# Altium schematic sheet Parallel_NOR_FLASH.SchDoc
size A3; SheetNumber: 8; SheetTotal: 15
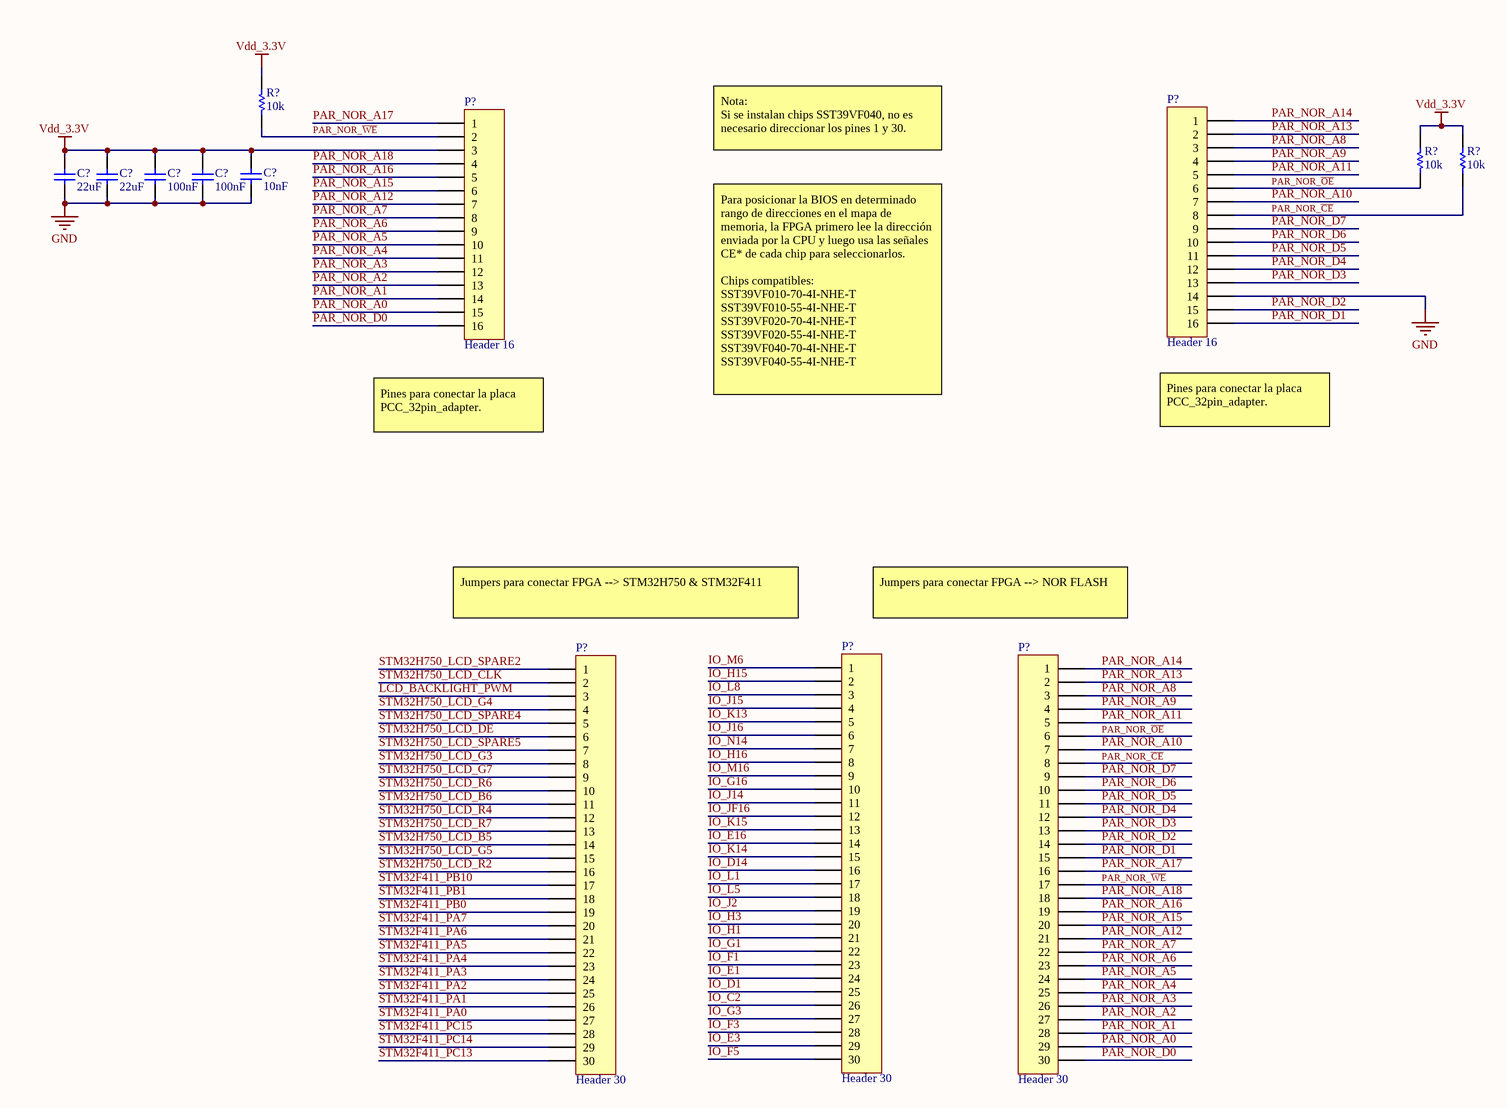
[diagram p0: Parallel_NOR_FLASH.SchDoc]

## Parts
(Parts that share a designator on the sheet are numbered #1, #2 ... from top to bottom, then left to right.)
C?#1  value 22uF  [capacitor 0603]  (hidden comment: ceramic capacitor)
C?#2  value 22uF  [capacitor 0603]  (hidden comment: ceramic capacitor)
C?#3  value 100nF  [capacitor 0603]  (hidden comment: Ceramic capacitor)
C?#4  value 100nF  [capacitor 0603]  (hidden comment: Ceramic capacitor)
C?#5  value 10nF  [capacitor 0603]  (hidden comment: Ceramic capacitor)
P?#1  Header 16  [HDR1X16]
P?#2  Header 16  [HDR1X16]
P?#3  Header 30  [HDR1X30]
P?#4  Header 30  [HDR1X30]
P?#5  Header 30  [HDR1X30]
R?#1  value 10k  [resistor 0603]  (hidden comment: resistor)
R?#2  value 10k  [resistor 0603]  (hidden comment: resistor)
R?#3  value 10k  [resistor 0603]  (hidden comment: resistor)

## Nets
GND: C?#1.1 C?#2.1 C?#3.1 C?#4.1 C?#5.1 P?#2.14
Vdd_3.3V: C?#1.2 C?#2.2 C?#3.2 C?#4.2 C?#5.2 P?#1.3 R?#1.1 R?#2.1 R?#3.1
IO_C2: P?#4.26
IO_D1: P?#4.25
IO_D14: P?#4.16
IO_E1: P?#4.24
IO_E3: P?#4.29
IO_E16: P?#4.14
IO_F1: P?#4.23
IO_F3: P?#4.28
IO_F5: P?#4.30
IO_G1: P?#4.22
IO_G3: P?#4.27
IO_G16: P?#4.10
IO_H1: P?#4.21
IO_H3: P?#4.20
IO_H15: P?#4.2
IO_H16: P?#4.8
IO_J2: P?#4.19
IO_J14: P?#4.11
IO_J15: P?#4.4
IO_J16: P?#4.6
IO_JF16: P?#4.12
IO_K13: P?#4.5
IO_K14: P?#4.15
IO_K15: P?#4.13
IO_L1: P?#4.17
IO_L5: P?#4.18
IO_L8: P?#4.3
IO_M6: P?#4.1
IO_M16: P?#4.9
IO_N14: P?#4.7
LCD_BACKLIGHT_PWM: P?#3.3
PAR_NOR_A0: P?#1.15 P?#5.29
PAR_NOR_A1: P?#1.14 P?#5.28
PAR_NOR_A2: P?#1.13 P?#5.27
PAR_NOR_A3: P?#1.12 P?#5.26
PAR_NOR_A4: P?#1.11 P?#5.25
PAR_NOR_A5: P?#1.10 P?#5.24
PAR_NOR_A6: P?#1.9 P?#5.23
PAR_NOR_A7: P?#1.8 P?#5.22
PAR_NOR_A8: P?#2.3 P?#5.3
PAR_NOR_A9: P?#2.4 P?#5.4
PAR_NOR_A10: P?#2.7 P?#5.7
PAR_NOR_A11: P?#2.5 P?#5.5
PAR_NOR_A12: P?#1.7 P?#5.21
PAR_NOR_A13: P?#2.2 P?#5.2
PAR_NOR_A14: P?#2.1 P?#5.1
PAR_NOR_A15: P?#1.6 P?#5.20
PAR_NOR_A16: P?#1.5 P?#5.19
PAR_NOR_A17: P?#1.1 P?#5.16
PAR_NOR_A18: P?#1.4 P?#5.18
PAR_NOR_~{CE}: P?#2.8 P?#5.8 R?#3.2
PAR_NOR_D0: P?#1.16 P?#5.30
PAR_NOR_D1: P?#2.16 P?#5.15
PAR_NOR_D2: P?#2.15 P?#5.14
PAR_NOR_D3: P?#2.13 P?#5.13
PAR_NOR_D4: P?#2.12 P?#5.12
PAR_NOR_D5: P?#2.11 P?#5.11
PAR_NOR_D6: P?#2.10 P?#5.10
PAR_NOR_D7: P?#2.9 P?#5.9
PAR_NOR_~{OE}: P?#2.6 P?#5.6 R?#2.2
PAR_NOR_~{WE}: P?#1.2 P?#5.17 R?#1.2
STM32F411_PA0: P?#3.27
STM32F411_PA1: P?#3.26
STM32F411_PA2: P?#3.25
STM32F411_PA3: P?#3.24
STM32F411_PA4: P?#3.23
STM32F411_PA5: P?#3.22
STM32F411_PA6: P?#3.21
STM32F411_PA7: P?#3.20
STM32F411_PB0: P?#3.19
STM32F411_PB1: P?#3.18
STM32F411_PB10: P?#3.17
STM32F411_PC13: P?#3.30
STM32F411_PC14: P?#3.29
STM32F411_PC15: P?#3.28
STM32H750_LCD_B5: P?#3.14
STM32H750_LCD_B6: P?#3.11
STM32H750_LCD_CLK: P?#3.2
STM32H750_LCD_DE: P?#3.6
STM32H750_LCD_G3: P?#3.8
STM32H750_LCD_G4: P?#3.4
STM32H750_LCD_G5: P?#3.15
STM32H750_LCD_G7: P?#3.9
STM32H750_LCD_R2: P?#3.16
STM32H750_LCD_R4: P?#3.12
STM32H750_LCD_R6: P?#3.10
STM32H750_LCD_R7: P?#3.13
STM32H750_LCD_SPARE2: P?#3.1
STM32H750_LCD_SPARE4: P?#3.5
STM32H750_LCD_SPARE5: P?#3.7

## Notes on the sheet
- Nota:
  Si se instalan chips SST39VF040, no es necesario direccionar los pines 1 y 30.
- (near P?#1) Pines para conectar la placa PCC_32pin_adapter.
- Para posicionar la BIOS en determinado rango de direcciones en el mapa de memoria, la FPGA primero lee la dirección enviada por la CPU y luego usa las señales CE* de cada chip para seleccionarlos.
  Chips compatibles:
  SST39VF010-70-4I-NHE-T
  SST39VF010-55-4I-NHE-T
  SST39VF020-70-4I-NHE-T
  SST39VF020-55-4I-NHE-T
  SST39VF040-70-4I-NHE-T
  SST39VF040-55-4I-NHE-T
- (near P?#2) Pines para conectar la placa PCC_32pin_adapter.
- (near P?#3) Jumpers para conectar FPGA --> STM32H750 & STM32F411
- (near P?#5) Jumpers para conectar FPGA --> NOR FLASH

## Library data of the parts
C?#1 C?#2 = ceramic capacitor: Multilayer ceramic capacitor; V: 6.3; LCSC part: C59461; Package: 0603
C?#3-C?#5 = Ceramic capacitor: Multilayer ceramic capacitor; V: 50; Package: 0603
  C?#3 C?#4: LCSC part: C14663
  C?#5: LCSC part: C1591
P?#1 P?#2 = Header 16: Header, 16-Pin; LatestRevisionDate: 17-Jul-2002; LatestRevisionNote: Re-released for DXP Platform.; Publisher: Altium Limited
P?#3-P?#5 = Header 30: Header, 30-Pin; LatestRevisionDate: 17-Jul-2002; LatestRevisionNote: Re-released for DXP Platform.; Publisher: Altium Limited
R?#1-R?#3 = resistor: Package: 0603